# Altium schematic sheet Power_Section.SchDoc
size A4
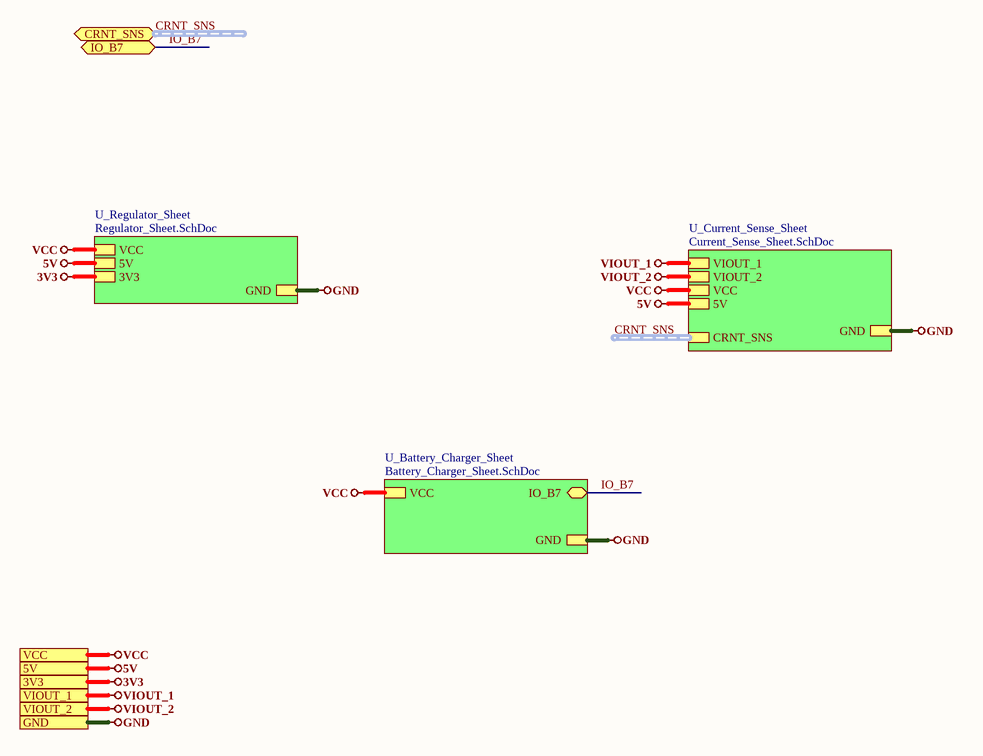
[diagram p0: Power_Section.SchDoc]

## Sub-sheets
U_Battery_Charger_Sheet = Battery_Charger_Sheet.SchDoc: VCC, GND, IO_B7 (bidir)
U_Current_Sense_Sheet = Current_Sense_Sheet.SchDoc: CRNT_SNS (harness CRNT_SNS), VIOUT_1, VCC, 5V, VIOUT_2, GND
U_Regulator_Sheet = Regulator_Sheet.SchDoc: VCC, 5V, 3V3, GND

## Ports
3V3, 5V, CRNT_SNS (bidir, harness CRNT_SNS), GND, IO_B7 (bidir), VCC, VIOUT_1, VIOUT_2

## Nets
3V3: port 3V3, sheet U_Regulator_Sheet/3V3
5V: port 5V, sheet U_Regulator_Sheet/5V, sheet U_Current_Sense_Sheet/5V
GND: port GND, sheet U_Regulator_Sheet/GND, sheet U_Current_Sense_Sheet/GND, sheet U_Battery_Charger_Sheet/GND
VCC: port VCC, sheet U_Regulator_Sheet/VCC, sheet U_Current_Sense_Sheet/VCC, sheet U_Battery_Charger_Sheet/VCC
VIOUT_1: port VIOUT_1, sheet U_Current_Sense_Sheet/VIOUT_1
VIOUT_2: port VIOUT_2, sheet U_Current_Sense_Sheet/VIOUT_2
IO_B7: port IO_B7, sheet U_Battery_Charger_Sheet/IO_B7

## Buses and harness runs
harness CRNT_SNS = port CRNT_SNS
harness CRNT_SNS = sheet U_Current_Sense_Sheet/CRNT_SNS